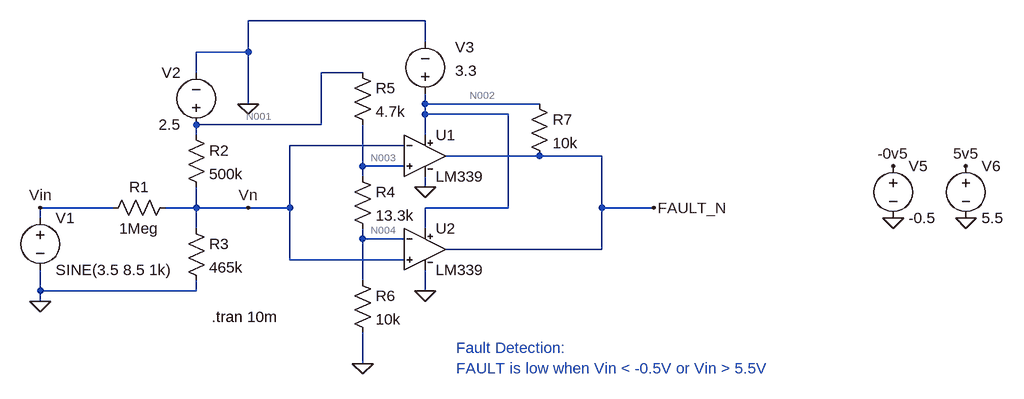
[diagram p0: schematic Fault Detection.asc]
Fault Detection.asc, the LTspice schematic file:
Version 4.1
SHEET 1 2432 680
WIRE 560 -144 288 -144
WIRE 560 -112 560 -144
WIRE 288 -96 288 -144
WIRE 288 -96 208 -96
WIRE 208 -64 208 -96
WIRE 464 -64 400 -64
WIRE 288 -16 288 -96
WIRE 560 -16 560 -32
WIRE 736 -16 560 -16
WIRE 560 0 560 -16
WIRE 688 0 560 0
WIRE 400 16 400 -64
WIRE 400 16 208 16
WIRE 208 32 208 16
WIRE 560 32 560 0
WIRE 528 48 352 48
WIRE 736 64 592 64
WIRE 832 64 736 64
WIRE 464 80 464 16
WIRE 528 80 464 80
WIRE 464 96 464 80
WIRE 560 112 560 96
WIRE 80 144 -32 144
WIRE 208 144 208 112
WIRE 208 144 160 144
WIRE 288 144 208 144
WIRE 352 144 352 48
WIRE 352 144 288 144
WIRE 688 144 688 0
WIRE 688 144 560 144
WIRE 832 144 832 64
WIRE 912 144 832 144
WIRE -32 160 -32 144
WIRE 208 176 208 144
WIRE 560 176 560 144
WIRE 464 192 464 176
WIRE 528 192 464 192
WIRE 832 208 832 144
WIRE 832 208 592 208
WIRE 352 224 352 144
WIRE 528 224 352 224
WIRE 464 256 464 192
WIRE -32 272 -32 240
WIRE 208 272 208 256
WIRE 208 272 -32 272
WIRE 560 272 560 240
WIRE -32 288 -32 272
WIRE 464 384 464 336
FLAG -32 288 0
FLAG 288 -16 0
FLAG 464 384 0
FLAG 560 272 0
FLAG 560 112 0
FLAG 912 144 FAULT_N
FLAG -32 144 Vin
FLAG 288 144 Vn
FLAG 1280 160 0
FLAG 1392 160 0
FLAG 1280 80 -0v5
FLAG 1392 80 5v5
SYMBOL res 176 128 R90
WINDOW 0 0 56 VBottom 2
WINDOW 3 32 56 VTop 2
SYMATTR InstName R1
SYMATTR Value 1Meg
SYMBOL voltage -32 144 R0
WINDOW 123 0 0 Left 0
WINDOW 39 0 0 Left 0
SYMATTR InstName V1
SYMATTR Value SINE(3.5 8.5 1k)
SYMBOL res 192 16 R0
SYMATTR InstName R2
SYMATTR Value 500k
SYMBOL res 192 160 R0
SYMATTR InstName R3
SYMATTR Value 465k
SYMBOL voltage 208 32 R180
WINDOW 0 24 96 Left 2
WINDOW 3 24 16 Left 2
WINDOW 123 0 0 Left 0
WINDOW 39 0 0 Left 0
SYMATTR InstName V2
SYMATTR Value 2.5
SYMBOL res 448 80 R0
SYMATTR InstName R4
SYMATTR Value 13.3k
SYMBOL res 448 -80 R0
SYMATTR InstName R5
SYMATTR Value 4.7k
SYMBOL res 448 240 R0
SYMATTR InstName R6
SYMATTR Value 10k
SYMBOL voltage 560 -16 R180
WINDOW 0 -76 87 Left 2
WINDOW 3 -80 51 Left 2
WINDOW 123 0 0 Left 0
WINDOW 39 0 0 Left 0
SYMATTR InstName V3
SYMATTR Value 3.3
SYMBOL LM339 560 64 R0
SYMATTR InstName U1
SYMBOL LM339 560 208 R0
SYMATTR InstName U2
SYMBOL res 720 -32 R0
SYMATTR InstName R7
SYMATTR Value 10k
SYMBOL voltage 1280 64 R0
WINDOW 123 0 0 Left 0
WINDOW 39 0 0 Left 0
SYMATTR InstName V5
SYMATTR Value -0.5
SYMBOL voltage 1392 64 R0
WINDOW 123 0 0 Left 0
WINDOW 39 0 0 Left 0
SYMATTR InstName V6
SYMATTR Value 5.5
TEXT 232 312 Left 2 !.tran 10m
TEXT 608 360 Left 2 ;Fault Detection:\nFAULT is low when Vin < -0.5V or Vin > 5.5V

The netlist it stands for:
* Fault Detection.asc
R1 Vn Vin 1Meg
V1 Vin 0 SINE(3.5 8.5 1k)
R2 N001 Vn 500k
R3 Vn 0 465k
V2 N001 0 2.5
R4 N003 N004 13.3k
R5 N001 N003 4.7k
R6 N004 0 10k
V3 N002 0 3.3
X§U1 N003 Vn N002 0 FAULT_N LM339  ; pins In+ In- V+ V- OUT
X§U2 Vn N004 N002 0 FAULT_N LM339  ; pins In+ In- V+ V- OUT
R7 N002 FAULT_N 10k
V5 -0v5 0 -0.5
V6 5v5 0 5.5
.tran 10m
* Fault Detection:
* FAULT is low when Vin < -0.5V or Vin > 5.5V
.lib LM339.sub
.backanno
.end

* Results of the author's LTspice run, read from the files saved beside the schematic
* Operating Point, zero values left out:
*   V(-0v5) = -500 mV
*   V(5v5) = 5.5 V
*   V(fault_n) = 3.3 V
*   V(n001) = 2.5 V
*   V(n002) = 3.3 V
*   V(n003) = 2.08 V
*   V(n004) = 893.2 mV
*   V(vin) = 3.5 V
*   V(vn) = 1.66 V
*   I(R1) = -1.84 µA
*   I(R2) = 1.68 µA
*   I(R3) = 3.57 µA
*   I(R4) = 89.27 µA
*   I(R5) = 89.27 µA
*   I(R6) = 89.32 µA
*   I(R7) = 6.569 pA
*   I(V1) = -1.84 µA
*   I(V2) = -90.95 µA
*   I(V3) = -342.5 µA
*   Ix(u1:1) = 2.569 pA
*   Ix(u1:2) = -49.97 nA
*   Ix(u1:3) = 171.3 µA
*   Ix(u1:4) = -171.2 µA
*   Ix(u1:5) = 3.284 pA
*   Ix(u2:1) = 2.499 pA
*   Ix(u2:2) = -49.97 nA
*   Ix(u2:3) = 171.3 µA
*   Ix(u2:4) = -171.2 µA
*   Ix(u2:5) = 3.284 pA
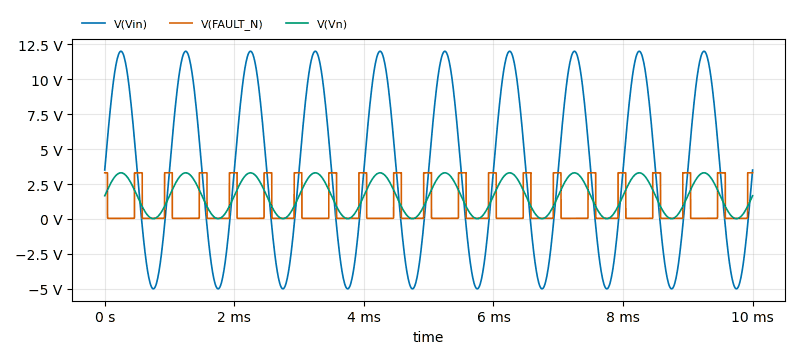
[diagram p1: Transient Analysis of Fault Detection.asc, plotted from the saved traces]
* Transient Analysis, 1 run:
*   V(Vin): min -5 V, max 12 V, average 3.5 V, rms 6.955 V, last 3.5 V
*   V(FAULT_N): min 42.93 mV, max 3.31 V, average 818.3 mV, rms 1.61 V, last 3.3 V
*   V(Vn): min 19.41 mV, max 3.301 V, average 1.659 V, rms 2.024 V, last 1.66 V